# EAGLE design mbc_80_21_10_01 (EAGLE 7.6.0)

## Sheet 1 of 2
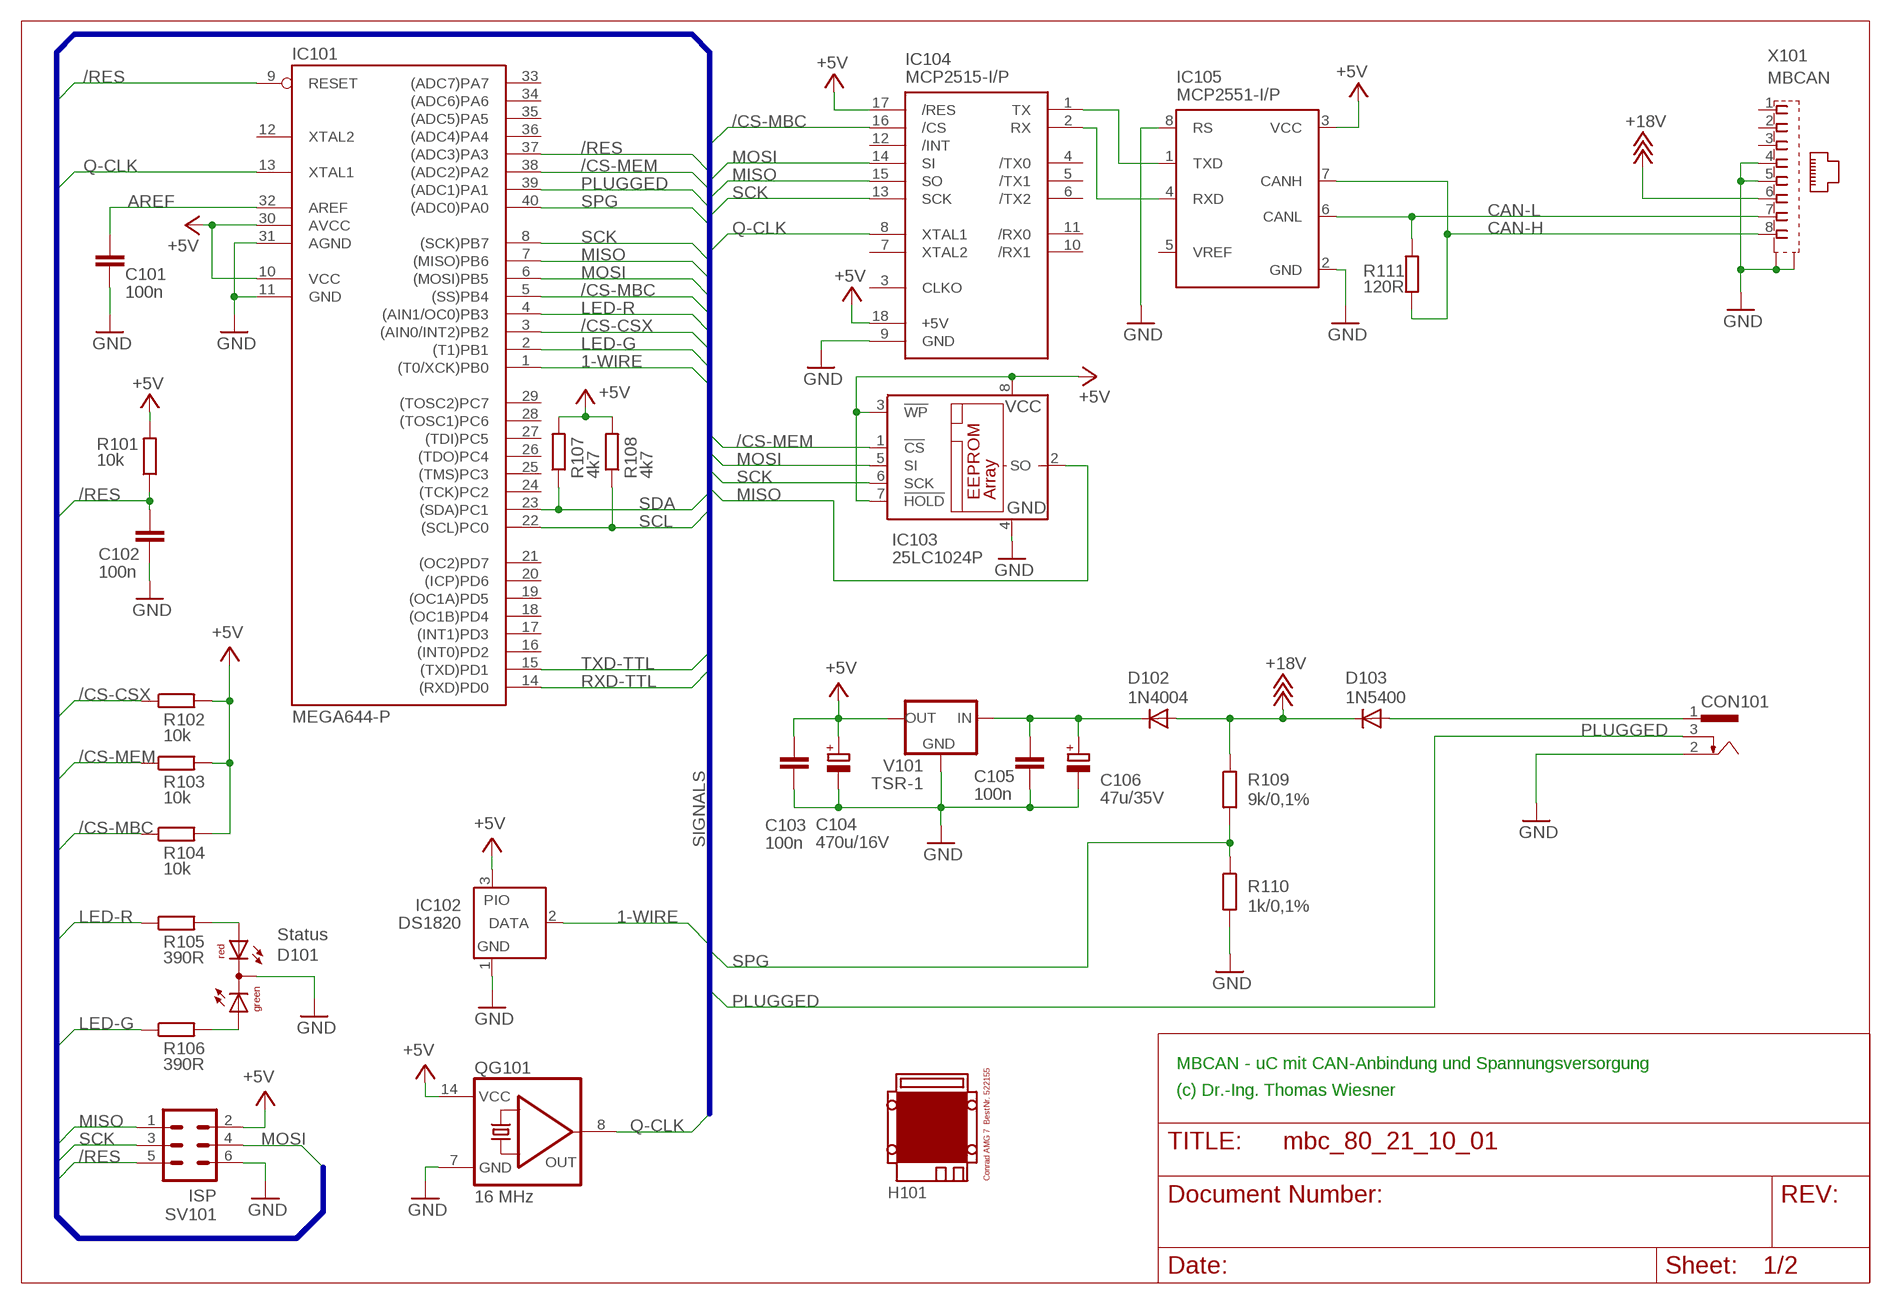
[diagram p0: schematic, sheet 1]

### Parts
C101  100n  C-EU025-025X050  [C025-025X050]
C102  100n  C-EU025-025X050  [C025-025X050]
C103  100n  C-EU025-025X050  [C025-025X050]
C104  470u/16V  CPOL-EUE3.5-8  [E3,5-8]
C105  100n  C-EU025-025X050  [C025-025X050]
C106  47u/35V  CPOL-EUE2.5-7  [E2,5-7]
CON101  POWER-JACK  [POWER-JACK]
D101  Status  DUOLED5MM  [DUOLED5MM]
D102  1N4004  [DO41-10]
D103  1N5400  [DO201-15]
H101  MODULGEHÄUSE-AMG-7  [MODULGEHÄUSE-AMG-7]
IC101  MEGA644-P  MEGA323-P  [DIL40]
IC102  DS1820  DS2405  [TO92-]
IC103  25LC1024P  25LC040P  [DIL8]
IC104  MCP2515-I/P  MCP2510-I/P  [DIL18]
IC105  MCP2551-I/P  PCA82C250  [DIL08]
QG101  16 MHz  QG5860  [DIL14S]
R101  10k  R-EU_0207/10  [0207/10]
R102  10k  R-EU_0207/10  [0207/10]
R103  10k  R-EU_0207/10  [0207/10]
R104  10k  R-EU_0207/10  [0207/10]
R105  390R  R-EU_0207/10  [0207/10]
R106  390R  R-EU_0207/10  [0207/10]
R107  4k7  R-EU_0207/10  [0207/10]
R108  4k7  R-EU_0207/10  [0207/10]
R109  9k/0,1%  R-EU_0207/10  [0207/10]
R110  1k/0,1%  R-EU_0207/10  [0207/10]
R111  120R  R-EU_0207/10  [0207/10]
SV101  ISP  ML6  [ML6]
V101  TSR-1  [TRACO-TSR-1]
X101  MBCAN  0446200002  [0446200002]

### Nets
1-WIRE: IC101.1((T0/XCK)PB0) IC102.2(DATA)
+5V: C103.1 C104.+ IC101.10(VCC) IC101.30(AVCC) IC102.3(PIO) IC103.3(!WP) IC103.7(!HOLD) IC103.8(VCC) IC104.17(/RES) IC104.18(+5V) IC105.3(VCC) QG101.14(VCC) R101.2 R102.2 R103.2 R104.2 R107.2 R108.2 SV101.2 V101.OUT ; also sheet 2
+18V: D102.A D103.C R109.1 X101.6
/CS-CSX: IC101.3((AIN0/INT2)PB2) R102.1 ; also sheet 2
/CS-MBC: IC101.5((SS)PB4) IC104.16(/CS) R104.1
/CS-MEM: IC101.38((ADC2)PA2) IC103.1(!CS) R103.1
/RES: C102.1 IC101.9(RESET) IC101.37((ADC3)PA3) R101.1 SV101.5
AREF: C101.1 IC101.32(AREF)
CAN-H: IC105.7(CANH) R111.1 X101.8
CAN-L: IC105.6(CANL) R111.2 X101.7
GND: C101.2 C102.2 C103.2 C104.- C105.2 C106.- CON101.2 D101.K(C) IC101.11(GND) IC101.31(AGND) IC102.1(GND) IC103.4(GND) IC104.9(GND) IC105.2(GND) IC105.8(RS) QG101.7(GND) R110.2 SV101.6 V101.GND X101.4 X101.5 X101.S@1(S1) X101.S@2(S2) ; also sheet 2
LED-G: IC101.2((T1)PB1) R106.1
LED-R: IC101.4((AIN1/OC0)PB3) R105.1
MISO: IC101.7((MISO)PB6) IC103.2(SO) IC104.15(SO) SV101.1 ; also sheet 2
MOSI: IC101.6((MOSI)PB5) IC103.5(SI) IC104.14(SI) SV101.4 ; also sheet 2
N$1: IC104.1(TX) IC105.1(TXD)
N$2: IC104.2(RX) IC105.4(RXD)
N$6: C105.1 C106.+ D102.C V101.IN
N$9: D101.AR R105.2
N$13: D101.AG R106.2
PLUGGED: CON101.3 IC101.39((ADC1)PA1)
Q-CLK: IC101.13(XTAL1) IC104.8(XTAL1) QG101.8(OUT) ; also sheet 2
RXD-TTL: IC101.14((RXD)PD0) ; also sheet 2
SCK: IC101.8((SCK)PB7) IC103.6(SCK) IC104.13(SCK) SV101.3 ; also sheet 2
SCL: IC101.22((SCL)PC0) R108.1 ; also sheet 2
SDA: IC101.23((SDA)PC1) R107.1 ; also sheet 2
SPG: IC101.40((ADC0)PA0) R109.2 R110.1
TXD-TTL: IC101.15((TXD)PD1) ; also sheet 2
V-NETZTEIL: CON101.1 D103.A
Unconnected: IC101.12(XTAL2) IC101.16((INT0)PD2) IC101.17((INT1)PD3) IC101.18((OC1B)PD4) IC101.19((OC1A)PD5) IC101.20((ICP)PD6) IC101.21((OC2)PD7) IC101.24((TCK)PC2) IC101.25((TMS)PC3) IC101.26((TDO)PC4) IC101.27((TDI)PC5) IC101.28((TOSC1)PC6) IC101.29((TOSC2)PC7) IC101.33((ADC7)PA7) IC101.34((ADC6)PA6) IC101.35((ADC5)PA5) IC101.36((ADC4)PA4) IC104.3(CLKO) IC104.4(/TX0) IC104.5(/TX1) IC104.6(/TX2) IC104.7(XTAL2) IC104.10(/RX1) IC104.11(/RX0) IC104.12(/INT) IC105.5(VREF) X101.1 X101.2 X101.3

### Buses
SIGNALS

### Notes on the sheet
- MBCAN - uC mit CAN-Anbindung und Spannungsversorgung
- (c) Dr.-Ing. Thomas Wiesner

## Sheet 2 of 2
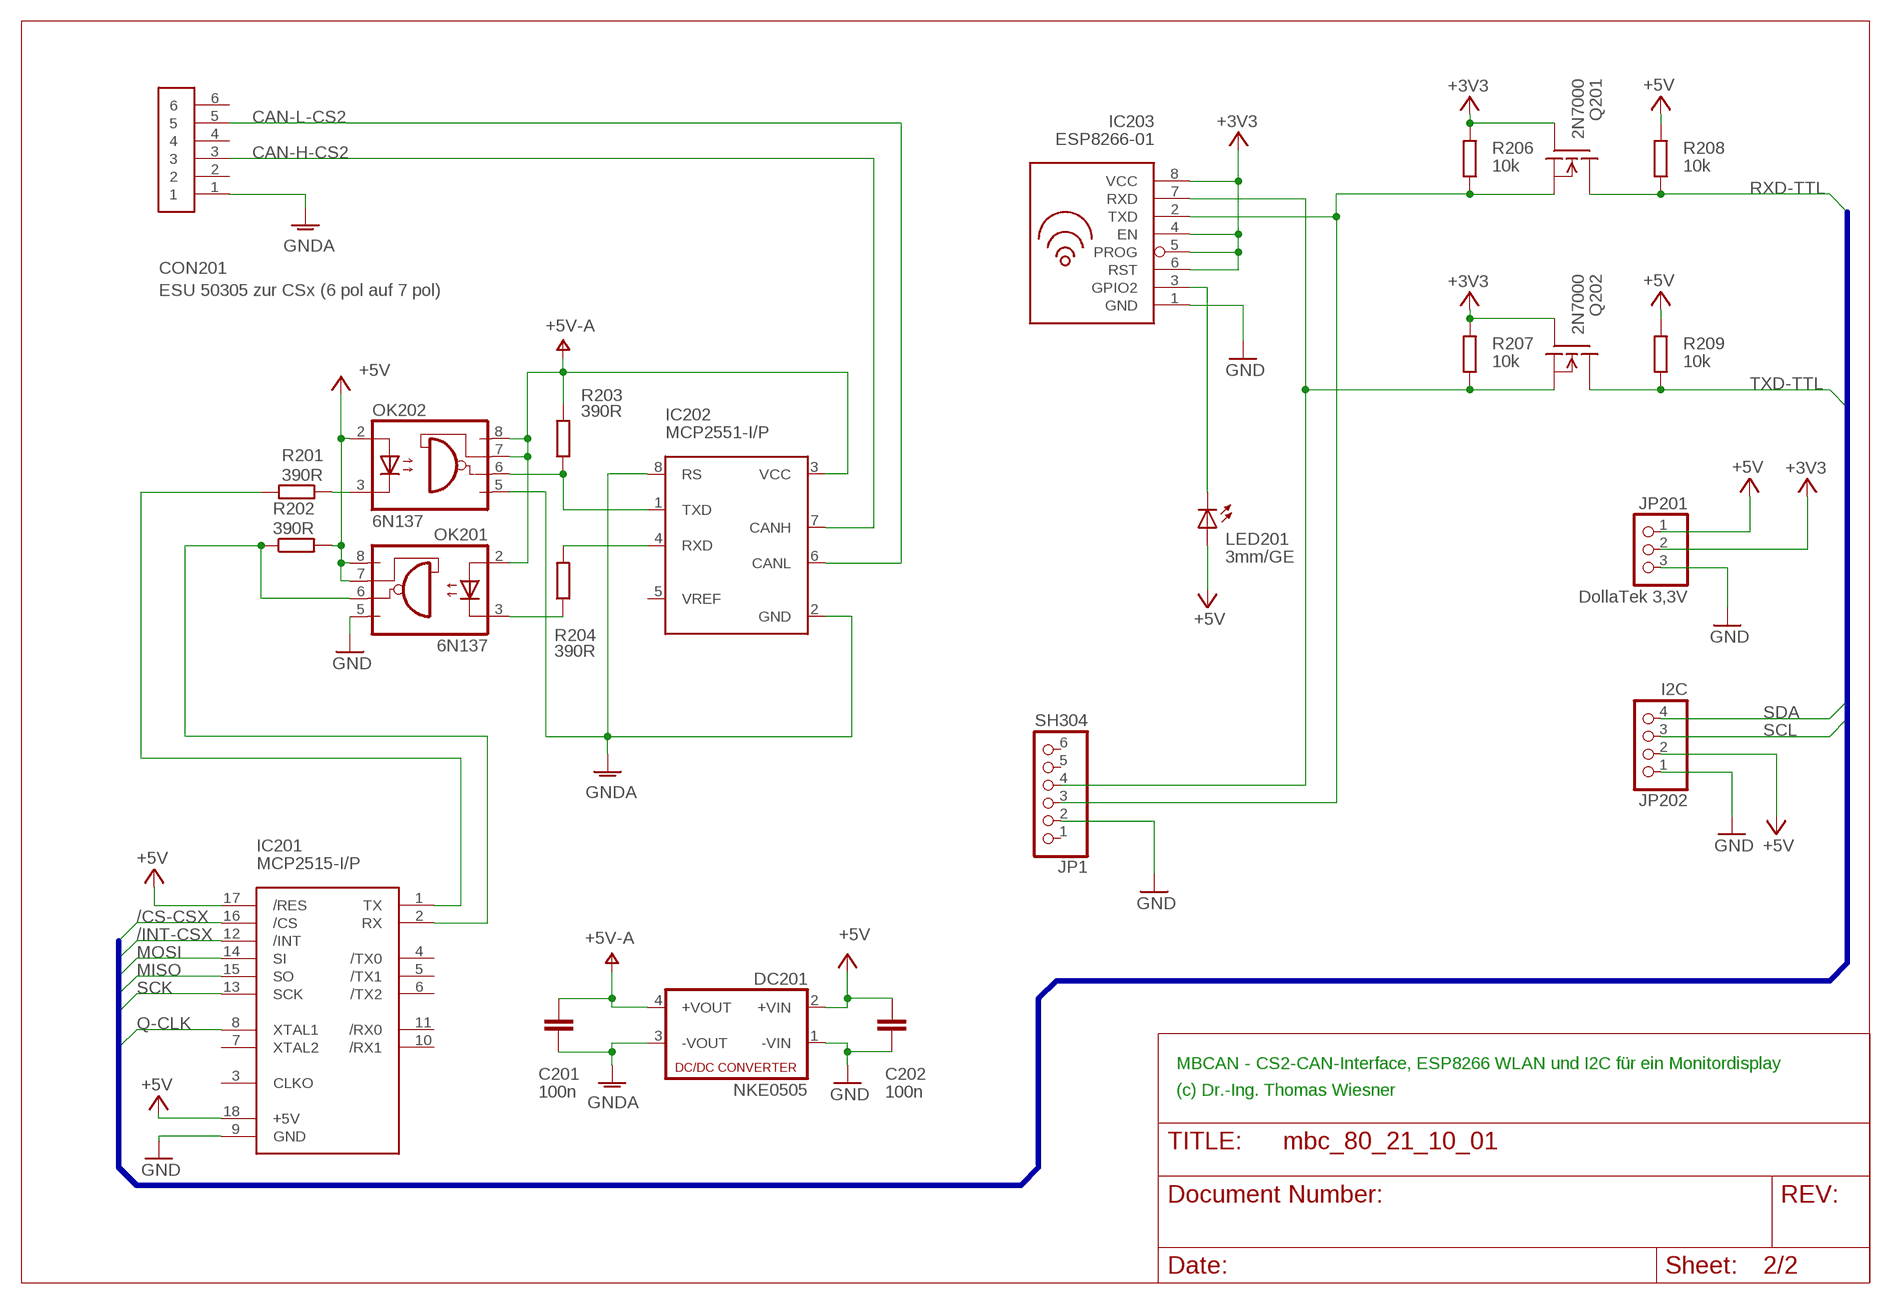
[diagram p1: schematic, sheet 2]

### Parts
C201  100n  C-EU025-025X050  [C025-025X050]
C202  100n  C-EU025-025X050  [C025-025X050]
CON201  ESU 50305 zur CSx (6 pol auf 7 pol)  TM-0508-A6  [MINI-DIN-6-POL]
DC201  NKE0505  NME  [NME]
IC201  MCP2515-I/P  MCP2510-I/P  [DIL18]
IC202  MCP2551-I/P  PCA82C250  [DIL08]
IC203  ESP8266-01  [ESP8266-01]
JP1  SH304  PINHD-1X6  [1X06]
JP201  DollaTek 3,3V  PINHD-1X3  [1X03]
JP202  I2C  PINHD-1X4  [1X04]
LED201  3mm/GE  LED3MM  [LED3MM]
OK201  6N137  [DIL08]
OK202  6N137  [DIL08]
Q201  2N7000  TN0602N3  [TO-92]
Q202  2N7000  TN0602N3  [TO-92]
R201  390R  R-EU_0207/10  [0207/10]
R202  390R  R-EU_0207/10  [0207/10]
R203  390R  R-EU_0207/10  [0207/10]
R204  390R  R-EU_0207/10  [0207/10]
R206  10k  R-EU_0207/10  [0207/10]
R207  10k  R-EU_0207/10  [0207/10]
R208  10k  R-EU_0207/10  [0207/10]
R209  10k  R-EU_0207/10  [0207/10]

### Nets
+3V3: IC203.4(EN) IC203.5(PROG) IC203.6(RST) IC203.8(VCC) JP201.2 Q201.2(G) Q202.2(G) R206.2 R207.2
+5V: C202.1 DC201.2(+VIN) IC201.17(/RES) IC201.18(+5V) JP201.1 JP202.2 LED201.A OK201.7(VE) OK201.8(VCC) OK202.2(A) R202.2 R208.2 R209.2 ; also sheet 1
+5V-A: C201.1 DC201.4(+VOUT) IC202.3(VCC) OK201.2(A) OK202.7(VE) OK202.8(VCC) R203.2
/CS-CSX: IC201.16(/CS) ; also sheet 1
/INT-CSX: IC201.12(/INT)
CAN-H-CS2: CON201.3 IC202.7(CANH)
CAN-L-CS2: CON201.5 IC202.6(CANL)
GND: C202.2 DC201.1(-VIN) IC201.9(GND) IC203.1(GND) JP1.2 JP201.3 JP202.1 OK201.5(GND) ; also sheet 1
GNDA: C201.2 CON201.1 DC201.3(-VOUT) IC202.2(GND) IC202.8(RS) OK202.5(GND)
MISO: IC201.15(SO) ; also sheet 1
MOSI: IC201.14(SI) ; also sheet 1
N$3: IC203.3(GPIO2) LED201.K(C)
N$5: IC203.2(TXD) JP1.3 Q201.1(S) R206.1
N$8: IC203.7(RXD) JP1.4 Q202.1(S) R207.1
N$10: IC201.1(TX) R201.2
N$40: IC202.1(TXD) OK202.6(VO) R203.1
N$43: OK201.3(C) R204.1
N$44: IC202.4(RXD) R204.2
N$46: OK202.3(C) R201.1
N$48: IC201.2(RX) OK201.6(VO) R202.1
Q-CLK: IC201.8(XTAL1) ; also sheet 1
RXD-TTL: Q201.3(D) R208.1 ; also sheet 1
SCK: IC201.13(SCK) ; also sheet 1
SCL: JP202.3 ; also sheet 1
SDA: JP202.4 ; also sheet 1
TXD-TTL: Q202.3(D) R209.1 ; also sheet 1
Unconnected: CON201.2 CON201.4 CON201.6 IC201.3(CLKO) IC201.4(/TX0) IC201.5(/TX1) IC201.6(/TX2) IC201.7(XTAL2) IC201.10(/RX1) IC201.11(/RX0) IC202.5(VREF) JP1.1 JP1.5 JP1.6

### Buses
SIGNALS

### Notes on the sheet
- MBCAN - CS2-CAN-Interface, ESP8266 WLAN und I2C für ein Monitordisplay
- (c) Dr.-Ing. Thomas Wiesner

## Library data of the parts
C101-C103 C105 C201 C202 = rcl:C-EU: CAPACITOR, European symbol
C104 C106 = rcl:CPOL-EU: POLARIZED CAPACITOR, European symbol
CON101 = mbc:POWER-JACK
CON201 = mbc:TM-0508-A6: MINI-DIN 6-pol Printbuchse Reichelt Bestellnummer EB-DIO M06
D101 = led:DUOLED5MM: DUO LED 2 colors, 5 mm, round
D102 = diode:1N4004: DIODE general purpose rectifier, 1 A
D103 = diode:1N5400: DIODE standard rectifier, 3 A, 50 V (Motorola)
DC201 = dc-dc-converter:NME: DC-DC CONVERTER; MF: C & D TECHNOLOGIES, INC; MPN: NME1205D; OC_FARNELL: 1021466; OC_NEWARK: 98B8198
H101 = mbc:MODULGEHÄUSE-AMG-7: Gehäuse Conrad AMG 7 BestNr. 522155
IC101 = atmel:MEGA323-P: MICROCONTROLLER 32 Kbytes FLASH 2 Kbytes SRAM 1 Kbytes EEPROM USART 8-channel 10 bit ADC Source: avr.lbr; OC_FARNELL: unknown; OC_NEWARK: unknown
IC102 = maxim:DS2405: Addressable Switch DALLAS Semiconductor; MF: DALLAS SEMICONDUCTOR; MPN: DS2405; OC_FARNELL: 1188025; OC_NEWARK: 06F4645
IC103 = microchip:25*: Serial EEPROM 4K/ 8K , SPI bus; MF: MICROCHIP; MPN: 25LC040/P; OC_FARNELL: 9758100; OC_NEWARK: 96K4091
IC104 IC201 = mbc:MCP2510: BASIC-CAN 2.0a Controller Stand-alone CAN controller von Microchip
IC105 IC202 = micro-philips:PCA82C250: CAN CONTROLLER INTERFACE; OC_FARNELL: 3692358; OC_NEWARK: unknown
IC203 = mbc:ESP8266-01
JP1 = pinhead:PINHD-1X6: PIN HEADER
JP201 = pinhead:PINHD-1X3: PIN HEADER
JP202 = pinhead:PINHD-1X4: PIN HEADER
LED201 = led:LED: LED OSRAM: - CHIPLED LG R971, LG N971, LY N971, LG Q971, LY Q971, LO R971, LY R971 LH N974, LH R974 LS Q976, LO Q976, LY Q976 LO Q996 - Hyper CHIPLED LW Q18S LB Q993, LB Q99A, LB R99A - SideLED LS A670, LO A670, LY A670, LG A670, LP A670 LB A673, LV A673, LT A673, LW A673 LH A674 LY A675 LS A676, LA A676, LO A676, LY A676, LW A676 LS A679, LY A679, LG A679 - Hyper Micro SIDELED® LS Y876, LA Y876, LO Y876, LY Y876 LT Y87S - SmartLED LW L88C, LW L88S LB L89C, LB L89S, LG L890 LS L89K, LO L89K, LY L89K LS L896, LA L896, LO L896, LY L896 - TOPLED LS T670, LO T670, LY T670, LG T670, LP T670 LSG T670, LSP T670, LSY T670, LOP T670, LYG T670 LG T671, LOG T671, LSG T671 LB T673, LV T673, LT T673, LW T673 LH T674 LS T676, LA T676, LO T676, LY T676, LB T676, LH T676, LSB T676, LW T676 LB T67C, LV T67C, LT T67C, LS T67K, LO T67K, LY T67K, LW E67C LS E67B, LA E67B, LO E67B, LY E67B, LB E67C, LV E67C, LT E67C LW T67C LS T679, LY T679, LG T679 LS T770, LO T770, LY T770, LG T770, LP T770 LB T773, LV T773, LT T773, LW T773 LH T774 LS E675, LA E675, LY E675, LS T675 LS T776, LA T776, LO T776, LY T776, LB T776 LHGB T686 LT T68C, LB T68C - Hyper Mini TOPLED® LB M676 - Mini TOPLED Santana® LG M470 LS M47K, LO M47K, LY M47K Source: http://www.osram.convergy.de LUXEON: - LUMILED® LXK2-PW12-R00, LXK2-PW12-S00, LXK2-PW14-U00, LXK2-PW14-V00 LXK2-PM12-R00, LXK2-PM12-S00, LXK2-PM14-U00 LXK2-PE12-Q00, LXK2-PE12-R00, LXK2-PE12-S00, LXK2-PE14-T00, LXK2-PE14-U00 LXK2-PB12-K00, LXK2-PB12-L00, LXK2-PB12-M00, LXK2-PB14-N00, LXK2-PB14-P00, LXK2-PB14-Q00 LXK2-PR12-L00, LXK2-PR12-M00, LXK2-PR14-Q00, LXK2-PR14-R00 LXK2-PD12-Q00, LXK2-PD12-R00, LXK2-PD12-S00 LXK2-PH12-R00, LXK2-PH12-S00 LXK2-PL12-P00, LXK2-PL12-Q00, LXK2-PL12-R00 Source: www.luxeon.com KINGBRIGHT: KA-3528ASYC Source: www.kingbright.com
OK201 OK202 = optocoupler:6N137: MOTOROLA OPTO COUPLER; MPN: 6N137; OC_FARNELL: 1328376; OC_NEWARK: 52M1895
Q201 Q202 = transistor-fet:TN0602N3: N-Channel Enhancement MOSFET 20V; 4A; 0,75Ohm
QG101 = crystal:QG5860: CRYSTAL RESONATOR; OC_FARNELL: unknown; OC_NEWARK: unknown
R101-R111 R201-R204 R206-R209 = resistor:R-EU_: RESISTOR, European symbol
SV101 = con-ml:ML6: HARTING; OC_FARNELL: unknown; OC_NEWARK: unknown
V101 = mbc:TSR-1: Spannungsregler Hersteller: TRACO Typ: TSR-1 5V: TSR 1-2450 Spg: 5V Strom: 1A Reichelt TSR 1-2450
X101 = mbc:0446200002: RJ-45 INVERTED MODULAR JACK ASSEMBLY WITH RJ-11 KEEPOUT FEATURE Source: Data sheet <http://www.farnell.com/datasheets/73207.pdf> MOLEX 0446200002 BUCHSE, RJ45, GESCHIRMT Source: Farnell <http://de.farnell.com/molex/0446200002/buchse-rj45-geschirmt/dp/9251910?ost=9251910>; MF: MOLEX; MPN: 0446200002; OC_FARNELL: 9251910

## Board
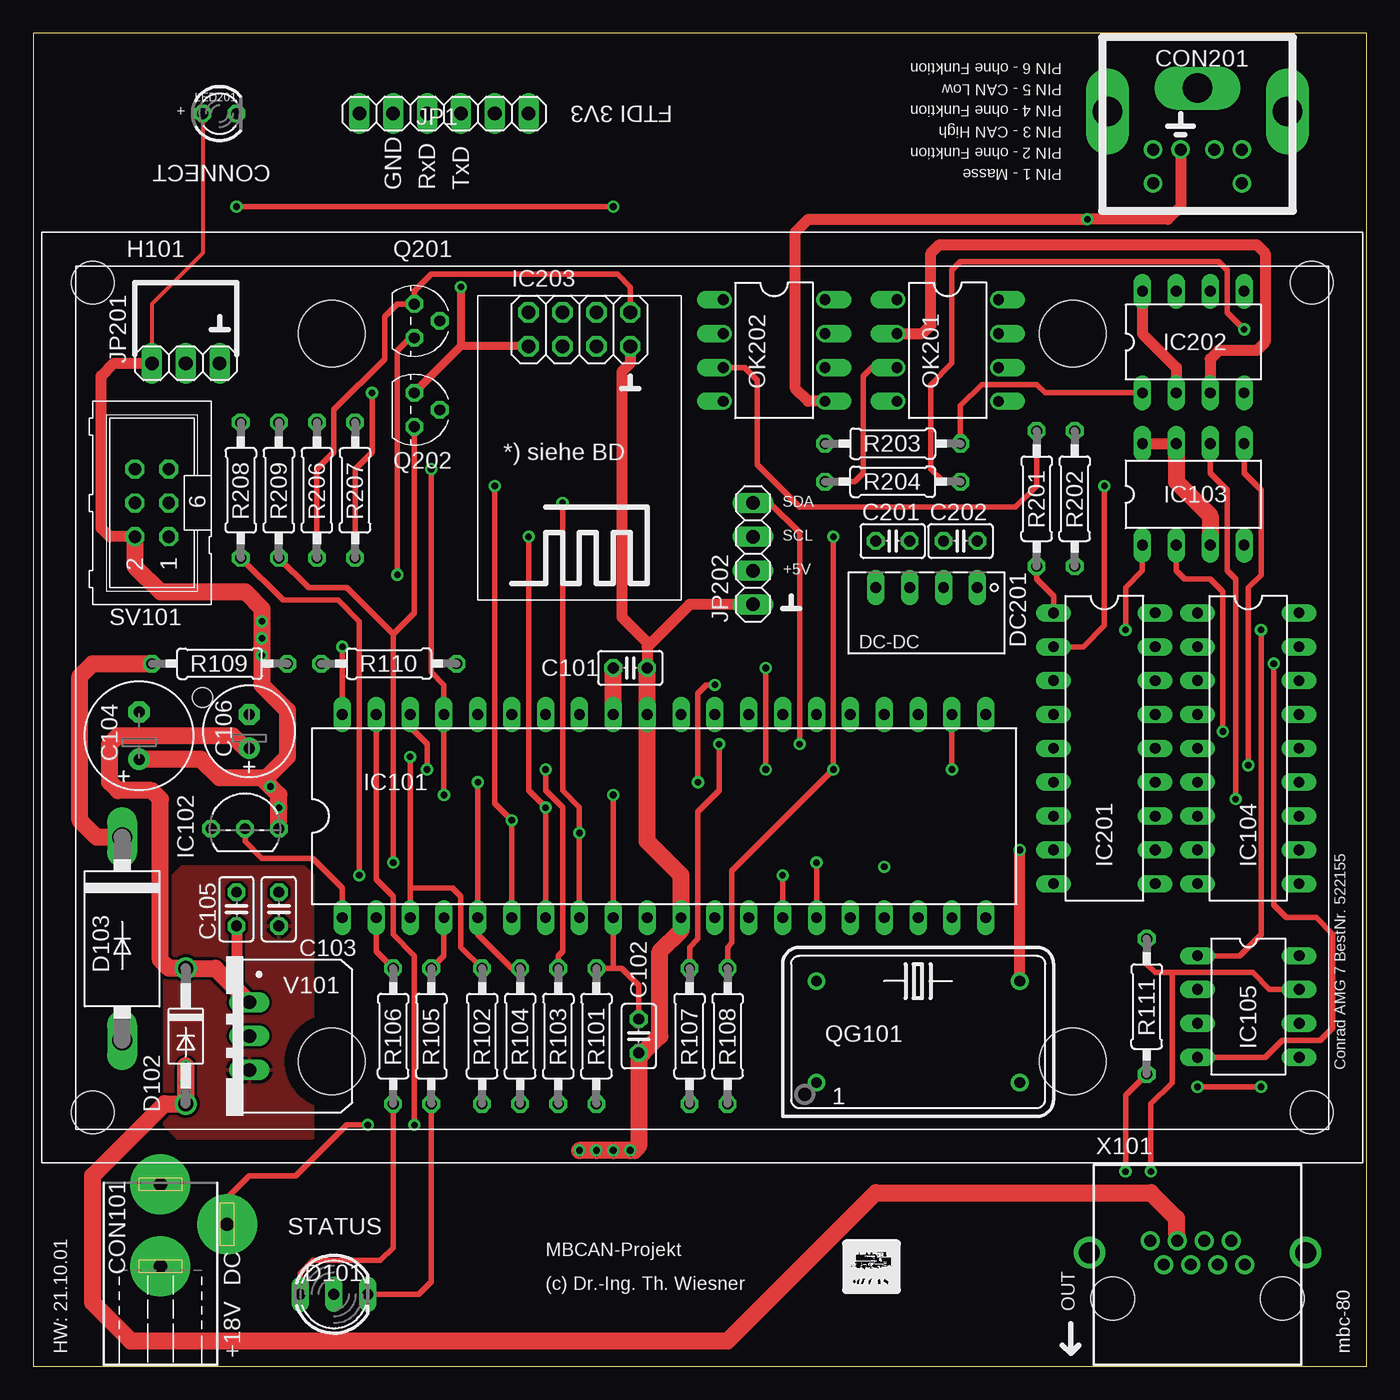
[diagram p2: board, top side]
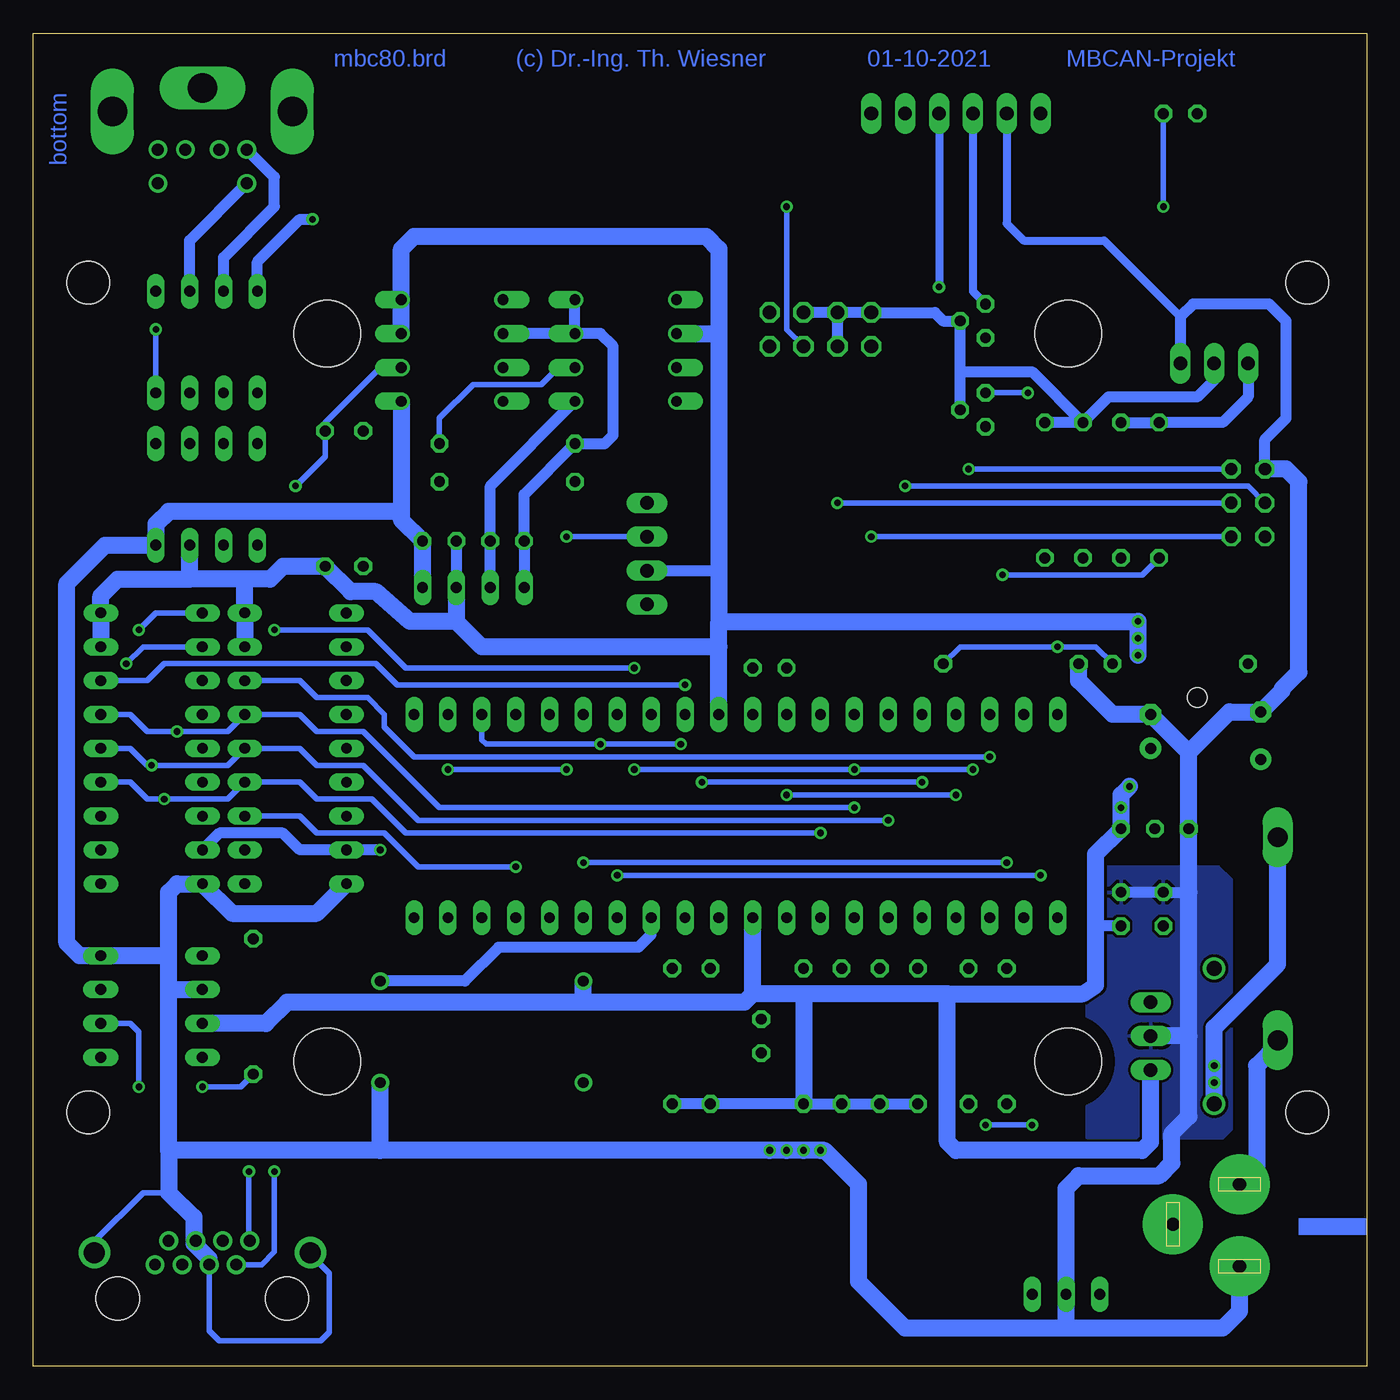
[diagram p3: board, bottom side, seen from below]

Size 99.99 x 100 mm. Coordinates in mm from the lower left corner, seen from the top.
Outline: 0,0 99.99,0 99.99,100 0,100 0,0
Copper layers (1*16): Top 0.035mm / dielectric 1.5mm / Bottom 0.035mm
Design rules "default *": minimum track width 10mil, minimum drill 0.5mm, track to track 8mil, track to pad 8mil, pad to pad 8mil, via to via 8mil, smd to smd 8mil, copper to edge 40mil, drill to drill 8mil, minimum pad ring 10mil, minimum via ring 8mil, stop-mask expansion 4mil, vias tented up to drill 0mil, thermal gap 10mil

### Footprints (pad centres in the part's own frame; a part is rotated, then mirrored left to right if it is on the bottom)
C025-025X050 = drill 0.813 octagon: 1 -1.27,0; 2 1.27,0
E3,5-8 = drill 0.813 pad 1.6: + -1.778,0 | drill 0.813 pad 1.6 octagon: - 1.778,0
E2,5-7 = drill 0.813 pad 1.6: + -1.27,0 | drill 0.813 pad 1.6 octagon: - 1.27,0
POWER-JACK = drill 1 pad 4.5: 1 0,6.03; 2 0,-0.12; 3 5,3.03
MINI-DIN-6-POL = drill 0.9: 1 -1.27,-4.604; 2 1.27,-4.604; 3 -3.334,-4.604; 4 3.334,-4.604; 5 -3.334,-7.144; 6 3.334,-7.144 | drill 2.2 pad 2.54 long: A1 0,0.01; A2 -6.75,-1.746; A3 6.75,-1.746
DUOLED5MM = drill 0.813 long: AG -2.54,0; AR 2.54,0; K 0,0
DO41-10 = drill 1.118: A 5.08,0; C -5.08,0
DO201-15 = drill 1.499 long: A 7.62,0; C -7.62,0
NME = drill 0.813 long: 1 0,3.81; 2 0,1.27; 3 0,-1.27; 4 0,-3.81
MODULGEHÄUSE-AMG-7 = hole 3.2: -45.72,-31.115; -45.72,31.115; 45.72,31.115; 45.72,-31.115 | hole 5: -27.781,-27.305; 27.781,-27.305; -27.781,27.305; 27.781,27.305 | hole 1.5: -37.465,0
DIL40 = drill 0.813 long: 1 -24.13,-7.62; 2 -21.59,-7.62; 3 -19.05,-7.62; 4 -16.51,-7.62; 5 -13.97,-7.62; 6 -11.43,-7.62; 7 -8.89,-7.62; 8 -6.35,-7.62; 9 -3.81,-7.62; 10 -1.27,-7.62; 11 1.27,-7.62; 12 3.81,-7.62; 13 6.35,-7.62; 14 8.89,-7.62; 15 11.43,-7.62; 16 13.97,-7.62; 17 16.51,-7.62; 18 19.05,-7.62; 19 21.59,-7.62; 20 24.13,-7.62; 21 24.13,7.62; 22 21.59,7.62; 23 19.05,7.62; 24 16.51,7.62; 25 13.97,7.62; 26 11.43,7.62; 27 8.89,7.62; 28 6.35,7.62; 29 3.81,7.62; 30 1.27,7.62; 31 -1.27,7.62; 32 -3.81,7.62; 33 -6.35,7.62; 34 -8.89,7.62; 35 -11.43,7.62; 36 -13.97,7.62; 37 -16.51,7.62; 38 -19.05,7.62; 39 -21.59,7.62; 40 -24.13,7.62
TO92- = drill 0.813 octagon: 1 -2.54,0; 2 0,0; 3 2.54,0
DIL8 = drill 0.813 long: 1 -3.81,-3.81; 2 -1.27,-3.81; 3 1.27,-3.81; 4 3.81,-3.81; 5 3.81,3.81; 6 1.27,3.81; 7 -1.27,3.81; 8 -3.81,3.81
DIL18 = drill 0.813 long: 1 -10.16,-3.81; 2 -7.62,-3.81; 3 -5.08,-3.81; 4 -2.54,-3.81 | drill 0.8 long: 5 0,-3.81; 6 2.54,-3.81; 7 5.08,-3.81; 8 7.62,-3.81; 9 10.16,-3.81; 10 10.16,3.81; 11 7.62,3.81; 12 5.08,3.81; 13 2.54,3.81; 14 0,3.81; 15 -2.54,3.81; 16 -5.08,3.81; 17 -7.62,3.81; 18 -10.16,3.81
DIL08 = drill 0.813 long: 1 -3.81,-3.81; 2 -1.27,-3.81; 3 1.27,-3.81; 4 3.81,-3.81; 5 3.81,3.81; 6 1.27,3.81; 7 -1.27,3.81; 8 -3.81,3.81
ESP8266-01 = drill 1.016 octagon: 1 3.81,-1.27; 2 3.81,1.27; 3 1.27,-1.27; 4 1.27,1.27; 5 -1.27,-1.27; 6 -1.27,1.27; 7 -3.81,-1.27; 8 -3.81,1.27
1X06 = drill 1.016 long: 1 -6.35,0; 2 -3.81,0; 3 -1.27,0; 4 1.27,0; 5 3.81,0; 6 6.35,0
1X03 = drill 1.016 long: 1 -2.54,0; 2 0,0; 3 2.54,0
1X04 = drill 1.016 long: 1 -3.81,0; 2 -1.27,0; 3 1.27,0; 4 3.81,0
LED3MM = drill 0.813 octagon: A -1.27,0; K 1.27,0
DIL08' = drill 0.813 offset: 1 -3.81,-3.81; 2 -1.27,-3.81; 3 1.27,-3.81; 4 3.81,-3.81; 5 3.81,3.81; 6 1.27,3.81; 7 -1.27,3.81; 8 -3.81,3.81
TO-92 = drill 0.813 octagon: 1 -1.27,0; 2 0,1.905; 3 1.27,0
DIL14S = drill 0.813: 1 -7.62,-3.81; 7 7.62,-3.81; 8 7.62,3.81; 14 -7.62,3.81
0207/10 = drill 0.813 octagon: 1 -5.08,0; 2 5.08,0
ML6 = drill 0.914 octagon: 1 -2.54,-1.27; 2 -2.54,1.27; 3 0,-1.27; 4 0,1.27; 5 2.54,-1.27; 6 2.54,1.27
TRACO-TSR-1 = drill 1.016 long: GND 0,2.54; IN -2.54,2.54; OUT 2.54,2.54
0446200002 = drill 0.889 pad 1.422: 1 3.556,2.54; 2 2.54,4.318; 3 1.524,2.54; 4 0.508,4.318; 5 -0.508,2.54; 6 -1.524,4.318; 7 -2.54,2.54; 8 -3.556,4.318 | drill 1.575 pad 2.286: S@1 -8.103,3.429; S@2 8.103,3.429 | hole 3.251: 6.35,0; -6.35,0

### Placement (x,y rotation side)
C101  44.77,52.39 0 top
C102  45.4,24.77 270 top
C103  18.41,34.29 90 top
C104  7.94,47.31 90 top
C105  15.24,34.29 90 top
C106  16.19,47.62 90 top
C201  64.45,61.91 0 top
C202  69.53,61.91 0 top
CON101  9.53,7.62 0 top
CON201  87.31,95.89 0 top
D101  22.54,5.4 0 top
D102  11.43,24.77 270 top
D103  6.67,32.07 270 top
DC201  66.99,58.42 270 top
H101  50.16,50.16 0 top
IC101  47.31,41.27 0 top
IC102  15.88,40.32 0 top
IC103  87,65.41 0 top
IC104  91.12,46.35 270 top
IC105  91.12,26.99 270 top
IC201  80.33,46.35 270 top
IC202  87,76.83 0 top
IC203  40.96,77.79 0 top
JP1  30.8,93.98 0 top
JP201  11.43,75.25 0 top
JP202  53.98,60.96 90 top
LED201  13.97,93.98 0 top
OK201  6N137  [DIL08']  68.58,76.2 270 top
OK202  6N137  [DIL08']  55.56,76.2 270 top
Q201  28.57,78.42 270 top
Q202  28.57,71.75 270 top
QG101  66.36,25.08 0 top
R101  42.23,24.77 270 top
R102  33.66,24.77 270 top
R103  39.37,24.77 270 top
R104  36.51,24.77 270 top
R105  29.84,24.77 270 top
R106  26.99,24.77 270 top
R107  49.21,24.77 270 top
R108  52.07,24.77 270 top
R109  13.97,52.7 0 top
R110  26.67,52.7 180 top
R111  83.5,26.99 270 top
R201  75.25,65.09 270 top
R202  78.11,65.09 270 top
R203  64.45,69.22 180 top
R204  64.45,66.36 0 top
R206  21.27,65.72 90 top
R207  24.13,65.72 90 top
R208  15.56,65.72 90 top
R209  18.41,65.72 90 top
SV101  8.89,64.77 90 top
V101  13.65,24.77 270 top
X101  87.31,5.08 0 top

### Tracks (layer width: path | path; a pad name or v marks a point on that pad's centre or on a via)
1-WIRE
  Top 0.406: IC102.2 15.88,39.37 17.14,38.1 20.95,38.1 23.18,35.88 IC101.1
+3V3
  Bottom 0.813: 30.48,74.61 Q201.2 31.75,78.42 32.38,79.06 IC203.8 IC203.6 | R206.2 R207.2 | JP201.2 11.43,73.98 12.7,72.71 19.37,72.71 R206.2 | Q202.2 30.48,74.61 | 30.48,74.61 25.08,74.61 R206.2 | IC203.6 IC203.4 | IC203.6 IC203.5
+5V  (via drill 0.5)
  Top 0.305: LED201.A 12.7,83.5 8.89,79.69 JP201.1
  Top 0.813: IC103.8 IC103.7 | SV101.2 5.71,62.23 5.08,62.87 5.08,74.3 6.03,75.25 JP201.1
  Top 1.27: C104.+ 12.57,45.53 13.97,44.13 17.14,44.13 | IC102.3 v18.41,41.91 18.41,42.86 v17.78,43.5 17.14,44.13 | SV101.2 7.62,60.01 9.53,58.1 15.88,58.1 17.14,56.83 v17.14,55.88 v17.14,54.61 v17.14,53.34 17.14,51.12 19.05,49.21 19.05,45.72 17.46,44.13 17.14,44.13 | IC103.7 85.72,66.36 88.27,63.82 IC103.3
  Bottom 0.813: R209.2 R208.2 10.79,70.8 8.89,72.71 JP201.1 | C202.1 DC201.2 | C103.1 20.32,33.02 | JP202.2 48.58,59.69 | R108.2 R107.2 R101.2 R103.2 R104.2 R102.2
  Bottom 1.016: 88.27,59.69 88.42,59.21 88.58,59.05
  Bottom 1.27: IC104.17 IC104.18 94.93,57.78 93.66,59.05 88.58,59.05 | IC201.17 IC201.18 84.14,59.05 | 46.04,27.94 IC101.10 | 58.74,27.3 46.67,27.3 46.04,27.94 | 58.74,27.3 QG101.14 | 42.23,27.94 R101.2 | 31.43,27.94 21.27,27.94 20.32,28.57 20.32,33.02 20.32,38.42 IC102.3 v18.41,41.91 18.41,42.86 v17.78,43.5 | 31.43,27.94 42.23,27.94 | 42.23,27.94 46.04,27.94 | IC105.3 82.55,25.72 80.96,27.3 58.74,27.3 | V101.OUT 16.19,16.83 16.83,16.19 30.8,16.19 31.43,16.83 31.43,27.94 | IC101.30 48.58,53.98 | 48.58,53.98 48.58,55.88 | 48.58,55.88 v17.14,55.88 v17.14,54.61 v17.14,53.34 | 84.14,59.05 88.27,59.05 88.42,59.21 | 88.27,59.69 IC103.3 | OK201.8 OK201.7 72.39,83.82 71.44,84.77 49.53,84.77 48.58,83.82 48.58,77.47 | 48.58,77.47 48.58,59.69 48.58,55.88 | OK202.2 48.58,77.47 | 48.58,53.98 66.36,53.98 68.26,55.88 | DC201.2 68.26,55.88 | 68.26,55.88 71.75,55.88 74.3,58.1 76.2,58.1 R202.2 81.28,60.01 82.23,59.05 84.14,59.05
  pour Top: 11.11,37.47 20.32,37.47 20.95,36.83 20.95,17.14 10.79,17.14 9.84,18.1 9.84,36.2
+5V-A
  Top 0.813: OK201.2 66.67,77.47 67.31,78.11 67.31,83.5 67.94,84.14 91.76,84.14 92.39,83.5 92.39,76.83 91.76,76.2 88.9,76.2 88.27,75.56 IC202.3
  Bottom 0.813: DC201.4 C201.1 63.18,65.41 R203.2 57.15,69.22 56.52,69.85 56.52,76.52 57.47,77.47 OK202.7 | OK202.7 OK202.8 | OK202.7 OK201.2
+18V  (via drill 0.5)
  Top 1.27: R109.1 4.45,52.7 3.49,51.75 3.49,40.96 4.76,39.69 D103.C | D102.A 9.84,19.68 4.45,14.29 4.45,4.76 7.3,1.91 52.07,1.91 63.18,13.02 83.82,13.02 85.72,11.11 85.72,10.1 X101.6 | D102.A v11.43,21.27 v11.43,22.54 D102.A
  Bottom 1.27: D103.C 6.67,30.16 11.43,25.4 v11.43,21.27 D102.A
/CS-CSX  (via drill 0.5)
  Top 0.406: IC101.3 28.26,35.88 | 28.26,35.88 v28.26,45.72 | 28.26,35.88 31.43,35.88 32.07,35.24 32.07,31.43 R102.1
  Bottom 0.406: IC201.16 80.01,51.44 78.74,50.16 74.93,50.16 73.66,48.9 73.66,47.94 71.44,45.72 v28.26,45.72
/CS-MBC  (via drill 0.5)
  Top 0.406: v33.34,43.81 IC101.5 33.34,32.38 35.88,29.84 R104.1 | v49.85,43.81 49.85,50.48 50.48,51.12 v51.12,51.12
  Bottom 0.406: IC104.16 91.44,51.44 90.17,52.7 74.3,52.7 72.71,51.12 v51.12,51.12 | v49.85,43.81 v33.34,43.81
/CS-MEM  (via drill 0.5)
  Top 0.406: v29.53,44.77 29.53,46.67 28.26,47.94 IC101.38 | v81.92,55.24 81.92,58.42 83.19,59.69 IC103.1 | v54.93,44.77 v54.93,52.39 | R103.1 39.37,30.8 39.69,31.11 39.69,41.91 38.42,43.18 v38.42,44.77
  Bottom 0.406: v54.93,44.77 v38.42,44.77 v29.53,44.77 | v81.92,55.24 74.93,55.24 72.07,52.39 v54.93,52.39
/INT-CSX  (via drill 0.5)
  Bottom 0.406: IC201.12 80.01,41.27 78.74,40.01 73.66,40.01 71.12,37.47 v63.82,37.47
/RES  (via drill 0.5)
  Top 0.406: 43.5,29.84 IC101.9 v43.5,42.86 | R101.1 43.5,29.84 | 43.5,29.84 44.13,29.84 45.4,28.57 C102.1 | v29.84,67.31 29.84,52.07 30.8,51.12 IC101.37 v30.8,42.86
  Bottom 0.406: SV101.5 v29.84,67.31 | v30.8,42.86 v43.5,42.86
AREF
  Top 1.27: IC101.32 C101.1
CAN-H  (via drill 0.5)
  Top 0.406: v83.82,14.61 83.82,19.68 85.41,21.27 85.41,29.53 | 85.41,29.53 91.44,29.53 92.71,28.26 IC105.7 | R111.1 83.5,30.16 84.14,29.53 85.41,29.53
  Bottom 0.406: X101.8 83.82,9.4 v83.82,14.61
CAN-H-CS2
  Bottom 0.813: IC202.7 85.72,83.19 81.92,87 81.92,89.22 CON201.3
CAN-L  (via drill 0.5)
  Top 0.406: v81.92,14.61 81.92,20.32 R111.2 | v92.08,20.95 v87.31,20.95
  Bottom 0.406: X101.7 82.87,7.62 81.92,8.57 v81.92,14.61 | IC105.6 92.71,25.72 92.08,25.08 v92.08,20.95 | v87.31,20.95 84.45,20.95 R111.2
CAN-L-CS2
  Bottom 0.813: IC202.6 88.27,84.45 CON201.5
GND  (via drill 0.5)
  Top 0.813: IC203.1 44.77,75.25 44.13,74.61 44.13,56.2 46.04,54.29 46.04,53.98 | 46.04,53.98 C101.2 | JP202.1 49.21,57.15 46.04,53.98
  Top 1.27: C101.2 IC101.31 46.04,39.37 48.58,36.83 IC101.11 48.58,32.7 46.99,31.11 46.99,24.77 45.72,23.5 C102.2 45.4,16.51 45.09,16.19 v44.77,16.19 v43.5,16.19 v42.23,16.19 v40.96,16.19
  Bottom 0.406: X101.S@2 95.42,9.36 91.76,13.02 89.85,13.02 | X101.5 86.81,2.67 86.04,1.91 78.42,1.91 77.79,2.54 77.79,6.99 79.06,8.26 79.15,8.26 X101.S@1
  Bottom 0.61: 35.56,3.49 35.56,3.81 | JP1.2 26.99,85.72 25.72,84.45 19.68,84.45 13.97,78.74
  Bottom 0.813: IC105.8 95.25,30.8 | SV101.6 7.62,69.53 6.03,71.12 6.03,78.42 7.3,79.69 13.02,79.69 13.97,78.74 JP201.3 | 13.34,35.56 C105.2 C103.2
  Bottom 1.27: 22.54,2.86 10.79,2.86 9.53,4.13 CON101.2 | 22.54,2.86 D101.K 22.54,13.34 21.59,14.29 15.56,14.29 14.61,15.24 14.61,17.46 13.34,18.73 13.34,24.77 | 22.54,2.86 34.61,2.86 35.56,3.81 38.1,6.35 38.1,13.65 40.64,16.19 v40.96,16.19 v42.23,16.19 v43.5,16.19 v44.77,16.19 73.98,16.19 | 73.98,16.19 89.85,16.19 | 73.98,16.19 QG101.7 | 13.34,24.77 13.34,35.56 IC102.1 13.34,46.04 | 13.34,46.04 C106.- 19.05,48.9 21.59,51.44 R110.2 | 13.34,46.04 10.29,49.09 C104.- 6.35,50.67 6.35,50.8 5.08,52.07 5.08,66.36 6.03,67.31 SV101.6 | 89.85,16.19 89.85,28.26 | 89.85,28.26 IC105.2 | 89.85,30.8 IC105.8 | 89.85,28.26 89.85,30.8 | 89.85,30.8 89.85,35.56 89.22,36.2 IC104.9 85.09,33.97 78.74,33.97 IC201.9 | 95.25,30.8 96.52,30.8 97.47,31.75 97.47,58.74 94.61,61.59 IC103.4 90.81,63.18 89.85,64.14 72.71,64.14 72.39,63.82 | 13.34,24.77 V101.GND | 89.85,16.19 89.85,13.02 87.95,11.18 87.95,9.53 X101.4 87.95,9.21 86.81,8.06 X101.5 | DC201.1 C202.2 72.39,63.5 72.39,63.82 | OK201.5 72.39,63.82
  pour Bottom: 11.11,37.47 20,37.47 20.95,36.51 20.95,17.14 10.79,17.14 10.16,17.78 10.16,36.51
GNDA  (via drill 0.5)
  Top 0.813: IC202.8 83.19,77.47 85.72,74.93 IC202.2 | OK202.5 58.1,72.39 57.15,73.34 57.15,85.09 58.1,86.04 v79.06,86.04 85.09,86.04 86.04,87 CON201.1
  Bottom 0.813: DC201.3 C201.2 65.72,66.04 OK202.5 | IC202.8 83.19,82.87 80.01,86.04 v79.06,86.04
LED-G
  Top 0.406: R106.1 25.72,31.11 IC101.2
LED-R
  Top 0.406: R105.1 30.8,30.8 IC101.4
MISO  (via drill 0.5)
  Top 0.406: IC101.7 v38.42,41.91 37.15,43.18 v37.15,62.23 | v89.22,47.62 89.22,58.1 88.27,59.05 86.36,59.05 85.72,59.69 IC103.2
  Bottom 0.406: IC104.15 92.71,48.9 91.44,47.62 v89.22,47.62 85.41,47.62 IC201.15 80.01,48.9 78.74,47.62 75.25,47.62 69.53,41.91 v38.42,41.91 | SV101.1 v37.15,62.23
MOSI  (via drill 0.5)
  Top 0.406: v91.12,45.09 91.12,58.42 92.08,59.37 92.08,65.72 90.81,66.99 IC103.5 | IC101.6 v35.88,40.96 34.61,42.23 v34.61,66.04
  Bottom 0.406: IC104.14 92.71,46.35 91.44,45.09 v91.12,45.09 85.41,45.09 IC201.14 80.01,46.35 78.74,45.09 75.25,45.09 71.12,40.96 v35.88,40.96 | SV101.4 8.89,66.04 v34.61,66.04
N$1  (via drill 0.5)
  Top 0.406: v92.08,55.24 92.08,32.38 90.49,30.8 IC105.1
  Bottom 0.406: v92.08,55.24 90.81,56.52 IC104.1
N$2  (via drill 0.5)
  Top 0.406: v93.03,52.7 93.03,34.61 93.98,33.66 96.2,33.66 97.47,32.38 97.47,25.4 96.52,24.45 93.66,24.45 92.39,23.18 IC105.4
  Bottom 0.406: v93.03,52.7 91.76,53.98 IC104.2
N$3  (via drill 0.5)
  Top 0.406: v15.24,87 v43.5,87
  Bottom 0.406: LED201.K v15.24,87 | v43.5,87 43.5,77.79 IC203.3
N$5
  Top 0.406: R206.1 21.27,67.31 22.54,68.58 22.54,71.75 26.35,75.56 26.35,78.74 27.3,79.69 Q201.1 28.57,80.64 29.84,81.92 43.81,81.92 44.77,80.96 IC203.2
  Bottom 0.61: JP1.3 29.53,80.64 Q201.1
N$6
  Top 0.813: C105.1 15.24,28.26 15.4,28.1
  Top 1.27: C106.+ 15.88,46.35 14.92,47.31 6.35,47.31 5.71,46.67 5.71,43.81 6.35,43.18 8.89,43.18 9.53,42.55 9.53,30.48 10.16,29.84 D102.C 13.65,29.84 15.4,28.1 V101.IN
N$8  (via drill 0.5)
  Top 0.406: R207.1 24.13,67.31 25.4,68.58 v25.4,73.03
  Top 0.61: IC203.7 32.07,76.52 | 32.07,76.52 Q202.1 | v32.07,80.96 32.07,76.52
  Bottom 0.406: v25.4,73.03 Q202.1
  Bottom 0.61: JP1.4 v32.07,80.96
N$9
  Top 0.406: R105.2 29.84,6.35 28.89,5.4 D101.AR
N$10
  Top 0.406: R201.2 75.25,59.05 76.52,57.78 IC201.1
N$13
  Top 0.406: R106.2 26.99,8.89 26.04,7.94 20.95,7.94 20,6.99 D101.AG
N$40
  Top 0.406: IC202.1 75.88,73.03 75.25,73.66 71.12,73.66 69.53,72.07 R203.1
  Bottom 0.406: OK202.6 60.64,74.93 61.91,73.66 66.99,73.66 69.53,71.12 R203.1
N$43
  Top 0.406: R204.1 61.59,66.36 62.23,66.99 62.23,74.3 62.87,74.93 OK201.3
N$44  (via drill 0.5)
  Top 0.406: R204.2 68.26,66.36 67.31,67.31 67.31,73.66 68.9,75.25 68.9,82.23 69.53,82.87 88.9,82.87 89.53,82.23 89.53,79.06 v90.81,77.79
  Bottom 0.406: v90.81,77.79 IC202.4
N$46
  Top 0.406: OK202.3 53.34,74.93 54.29,73.98 54.29,67.63 57.47,64.45 73.66,64.45 75.25,66.04 R201.1
N$48  (via drill 0.5)
  Top 0.406: v80.33,66.04 80.33,55.56 78.74,53.98 IC201.2
  Bottom 0.406: OK201.6 73.98,74.93 78.11,70.8 R202.1 78.11,68.26 v80.33,66.04
PLUGGED  (via drill 0.5)
  Top 0.406: IC101.39 25.72,36.51 26.99,35.24 26.99,32.38 28.57,30.8 v28.57,18.1 | CON101.3 14.53,12.62 16.19,14.29 19.68,14.29 23.5,18.1 v25.08,18.1
  Bottom 0.406: v25.08,18.1 v28.57,18.1
Q-CLK  (via drill 0.5)
  Top 0.813: QG101.8 v73.98,38.73
  Bottom 0.813: IC101.13 53.66,32.38 54.61,31.43 65.09,31.43 67.63,28.89 QG101.8 | IC104.8 86.04,40.01 81.28,40.01 80.01,38.73 IC201.8 v73.98,38.73
RXD-TTL  (via drill 0.5)
  Top 0.406: IC101.14 v56.2,36.83 | v24.45,36.83 24.45,55.88 22.86,57.47 18.73,57.47 R208.1 | Q201.3 28.26,77.15 27.3,76.2 v27.3,59.37
  Bottom 0.406: v56.2,36.83 v24.45,36.83 | v27.3,59.37 16.83,59.37 R208.1
SCK  (via drill 0.5)
  Top 0.406: IC101.8 v40.96,40.01 40.96,41.91 39.69,43.18 v39.69,64.77 | v90.17,42.55 90.17,59.05 89.53,59.69 89.53,65.72 88.27,66.99 IC103.6
  Bottom 0.406: IC104.13 92.71,43.81 91.44,42.55 v90.17,42.55 85.41,42.55 IC201.13 80.01,43.81 78.74,42.55 74.61,42.55 72.07,40.01 v40.96,40.01 | SV101.3 v39.69,64.77
SCL  (via drill 0.5)
  Top 0.406: IC101.22 v68.9,44.77 | v60.01,62.23 v60.01,44.77 52.39,37.15 52.39,31.75 52.07,31.43 R108.1
  Bottom 0.406: v68.9,44.77 v60.01,44.77 | v60.01,62.23 JP202.3
SDA  (via drill 0.5)
  Top 0.406: v57.47,46.67 57.47,62.55 55.24,64.77 JP202.4 | R107.1 49.21,31.43 49.85,32.07 49.85,41.59 51.44,43.18 v51.44,46.67
  Bottom 0.406: IC101.23 66.36,46.99 66.04,46.67 v57.47,46.67 v51.44,46.67
SPG  (via drill 0.5)
  Top 0.406: v23.18,53.98 IC101.40
  Bottom 0.406: R109.2 20.32,53.98 v23.18,53.98 30.48,53.98 R110.1
TXD-TTL  (via drill 0.5)
  Top 0.406: IC101.15 v58.74,37.78 | v26.99,37.78 26.99,54.93 | 26.99,54.93 23.5,58.42 20.64,58.42 R209.1 | Q202.3 28.57,56.52 26.99,54.93
  Bottom 0.406: v58.74,37.78 v26.99,37.78
V-NETZTEIL
  Bottom 1.27: D103.A 6.67,24.13 8.26,22.54 8.26,14.92 CON101.1
(copper drawn outside any net)
  shapes: Bottom area x1

### Text on the board
Bottom: MBCAN-Projekt | 01-10-2021 | (c) Dr.-Ing. Th. Wiesner | mbc80.brd | bottom
tNames: PIN 6 - ohne Funktion | PIN 5 - CAN Low | + | FTDI 3V3 | PIN 4 - ohne Funktion | PIN 3 - CAN High | PIN 2 - ohne Funktion | CONNECT | PIN 1 - Masse | GND | RxD | TxD | *) siehe BD | SDA | SCL | +5V | STATUS | MBCAN-Projekt | DC | (c) Dr.-Ing. Th. Wiesner | OUT | HW: 21.10.01 | +18V | mbc-80